# Altium project AmpToADC_Project.PrjPcb
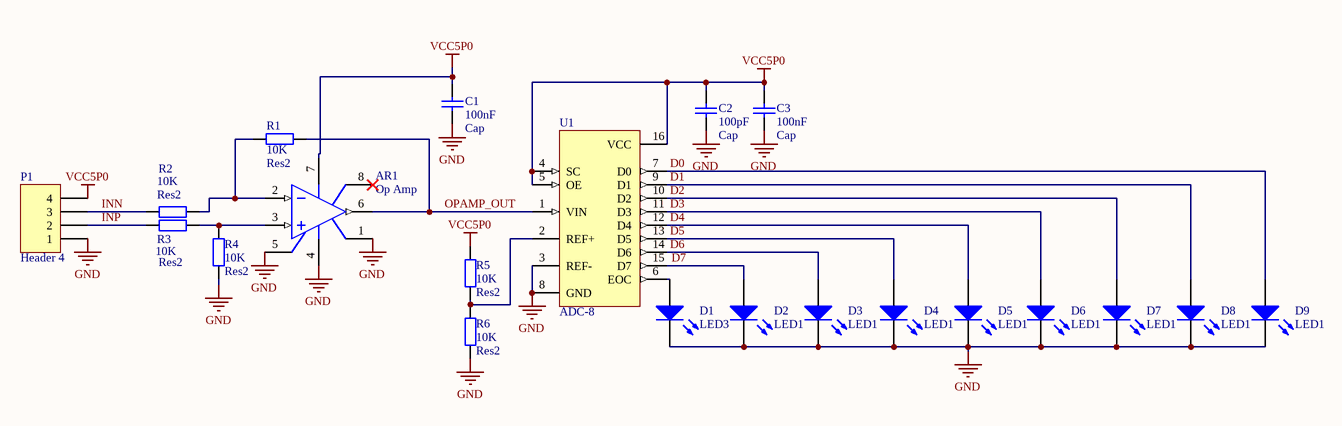
[diagram p0: Sheet1.SchDoc]
1 sheet, 21 parts. Net scope: global (net labels, ports and power ports of the same name join across sheets).
Board file: PCB1.PcbDoc

## Sheet Sheet1.SchDoc
size A4; SheetNumber: 1; SheetTotal: 1; SPICEModelCacheAFSLWBMC: <root> / <DocumentId>AFSLWBMC</DocumentId> / <CacheFrame Number="0"> / <Model Name="adc8" Kind="MDL"> / <Text>* 8-Bit generic A/D converter / * INPUTS  VCC, GND, VIN, VRP, VRM, SC, OE; / * OUTPUTS VCC_LD, SC_LD, OE_LD, OC, D0, D1, D2, D3, D4, D5, D6, D7; / .MODEL ADC8 xsimcode(file="{MODEL_PATH}ADC8.scb" func=ADC8 {mntymx})</Text> / </Model> / <Model Name="led3" Kind="MDL"> / <Text>*Typ BLUE SiC LED: Vf=3.4V Vr=5V If=40mA trr=3uS / *LED Pinout: 1=A, 2=K / .MODEL LED3 D (IS=93.1P RS=42M N=7.47 BV=5 IBV=30U / + CJO=2.97P VJ=.75 M=.333 TT=4.32U)</Text> / </Model> / <Model Name="led1" Kind="MDL"> / <Text>*Typ RED GaAs LED: Vf=1.7V Vr=4V If=40mA trr=3uS / *LED Pinout: 1=A, 2=K / .MODEL LED1 D (IS=93.2P RS=42M N=3.73 BV=4 IBV=10U / + CJO=2.97P VJ=.75 M=.333 TT=4.32U)</Text> / </Model> / </CacheFrame> / </root>

### Parts
AR1  Op Amp  [H-08A]
C1  Cap  value 100nF  [RAD-0.3]
C2  Cap  value 100pF  [RAD-0.3]
C3  Cap  value 100nF  [RAD-0.3]
D1  LED3  [3.5X2.8X1.9]
D2  LED1  [LED-1]
D3  LED1  [LED-1]
D4  LED1  [LED-1]
D5  LED1  [LED-1]
D6  LED1  [LED-1]
D7  LED1  [LED-1]
D8  LED1  [LED-1]
D9  LED1  [LED-1]
P1  Header 4  [HDR1X4]
R1  Res2  value 10K  [AXIAL-0.4]
R2  Res2  value 10K  [AXIAL-0.4]
R3  Res2  value 10K  [AXIAL-0.4]
R4  Res2  value 10K  [AXIAL-0.4]
R5  Res2  value 10K  [AXIAL-0.4]
R6  Res2  value 10K  [AXIAL-0.4]
U1  ADC-8  [SOT403-1_N]

### Nets
GND: AR1.1(OS_NUL) AR1.4(V-) AR1.5(OS_NUL) C1.2 C2.1 C3.1 D1.2(K) D2.2(K) D3.2(K) D4.2(K) D5.2(K) D6.2(K) D7.2(K) D8.2(K) D9.2(K) P1.1 R4.2 R6.1 U1.3(REF-) U1.8(GND)
VCC5P0: AR1.7(V+) C1.1 C2.2 C3.2 P1.4 R5.2 U1.4(SC) U1.5(OE) U1.16(VCC)
D0: D9.1(A) U1.7(D0)
D1: D8.1(A) U1.9(D1)
D2: D7.1(A) U1.10(D2)
D3: D6.1(A) U1.11(D3)
D4: D5.1(A) U1.12(D4)
D5: D4.1(A) U1.13(D5)
D6: D3.1(A) U1.14(D6)
D7: D2.1(A) U1.15(D7)
INN: P1.3 R2.1
INP: P1.2 R3.1
OPAMP_OUT: AR1.6(OUT) R1.2 U1.1(VIN)
NetAR1_2: AR1.2(IN-) R1.1 R2.2
NetAR1_3: AR1.3(IN+) R3.2 R4.1
NetD1_1: D1.1(A) U1.6(EOC)
NetR5_1: R5.1 R6.2 U1.2(REF+)

Not connected (* = marked no-connect by the designer): AR1 8(TAB)*

### Library data of the parts
AR1 = Op Amp: FET Operational Amplifier; Published: 8-Jun-2000; LatestRevisionDate: 17-Jul-2002; LatestRevisionNote: Re-released for DXP Platform.; DatasheetVersion: REV. B; PackageVersion: 1990; PackageReference: H-08A; Publisher: Altium Limited; PackageDescription: Can; 8 Leads; Pin Circle Dia. 5.08 mm; Lead Dia. 0.53 mm (max); ComponentLink1Description: Manufacturer Link; ComponentLink1URL: http://www.analog.com/
C1 C3 = Cap: Capacitor; Published: 8-Jun-2000; LatestRevisionDate: 17-Jul-2002; LatestRevisionNote: Re-released for DXP Platform.; PackageReference: RAD-0.3; Publisher: Altium Limited; PackageDescription: Radial Cap, Thru-Hole; 2 Leads; 0.3 in Pin Spacing
C2 = Cap: Monolith Capacitors / Ceramic Capacitors-DIP CAP_D7.5X5MM_TM 100pF ±5% 2KV SL; Manufacturer: TDK; Manufacturer Part Number: CC45SL3DD101JYVNA; Manufacturer Lifecycle Status: PRODUCTION; Published: 8-Jun-2000; LatestRevisionDate: 17-Jul-2002; LatestRevisionNote: Re-released for DXP Platform.; PackageReference: RAD-0.3; Publisher: Altium Limited; PackageDescription: Radial Cap, Thru-Hole; 2 Leads; 0.3 in Pin Spacing; Supplier: Mouser; Supplier Part Number: 810-CC45SL3DD101JYVN; RoHS: Compliant; Category: Ceramic Capacitors; Stock: 1862; Pricing: 1=0.34, 10=0.148, 50=0.148, 100=0.132, 1000=0.097, 10000=0.073 (USD); Case/Package: Radial; Contact Plating: Tin; Dielectric Material: Ceramic; Export Control Classification Number (ECCN) Code: EAR99; Height: 7.5mm; Harmonized Tariff Schedule (HTS) Code: 8532.23.00.60; Introduction Date: 2011-07-11; Length: 7.5mm; Lifecycle Status: Production; Max Operating Temperature: 125°C; Max Thickness: 5mm; Min Operating Temperature: -25°C; Number of Terminals: 2; REACH SVHC: Yes; Schedule B: 8532230060|8532230060|8532230060|8532230060|8532230060; Terminal Pitch: 5mm; Voltage Rating (DC): 2kV; Width: 5mm; ComponentLink1URL: https://datasheet.octopart.com:443/CC45SL3DD101JYVNA-TDK-datasheet-158279370.pdf?src-supplier=ODG+(Origin+Data+Global); ComponentLink1Description: https://datasheet.octopart.com:443/CC45SL3DD101JYVNA-TDK-datasheet-158279370.pdf?src-supplier=ODG+(Origin+Data+Global); ComponentLink2URL: https://datasheet.octopart.com:443/CC45SL3DD101JYVNA-TDK-datasheet-151651375.pdf?src-supplier=TDK; ComponentLink2Description: https://datasheet.octopart.com:443/CC45SL3DD101JYVNA-TDK-datasheet-151651375.pdf?src-supplier=TDK; ComponentLink3URL: https://datasheet.octopart.com:443/CC45SL3DD101JYVNA-TDK-datasheet-188931076.pdf?src-supplier=TME; ComponentLink3Description: https://datasheet.octopart.com:443/CC45SL3DD101JYVNA-TDK-datasheet-188931076.pdf?src-supplier=TME
D1 = LED3: Typical BLUE SiC LED; Published: 8-Jun-2000; LatestRevisionDate: 17-Dec-2003; LatestRevisionNote: PCB Footprint replaced.; DatasheetVersion: 16-Apr-2002; PackageVersion: 16-Apr-2002; PackageReference: 3.5X2.8X1.9; Publisher: Altium Limited; PackageDescription: SM LED; 2 C-Bend Leads; Body 3.5 x 2.8 x 1.9 mm, inc leads (LxWxH typ)
D2-D9 = LED1: Typical RED GaAs LED; Published: 8-Jun-2000; LatestRevisionDate: 08-Jul-2005; LatestRevisionNote: Mech Layer 1 removed.; PackageReference: LED-1; Publisher: Altium Limited; PackageDescription: LED; 2 Leads
P1 = Header 4: Header, 4-Pin; LatestRevisionDate: 17-Jul-2002; LatestRevisionNote: Re-released for DXP Platform.; Publisher: Altium Limited
R1-R6 = Res2: Resistor; Published: 8-Jun-2000; LatestRevisionDate: 17-Jul-2002; LatestRevisionNote: Re-released for DXP Platform.; PackageReference: AXIAL-0.4; Publisher: Altium Limited; PackageDescription: Axial Device, Thru-Hole; 2 Leads; 0.4 in Pin Spacing
U1 = ADC-8: Generic 8-Bit A/D Converter; Published: 8-Jun-2000; LatestRevisionDate: 29-May-2009; LatestRevisionNote: IPC-7351 Footprint Added.; PackageVersion: Mar-2002; PackageReference: SOT403-1; Publisher: Altium Limited; PackageDescription: 16-Pin Thin Small Outline Package 0.65 mm Pitch; Code_JEDEC: MO-153